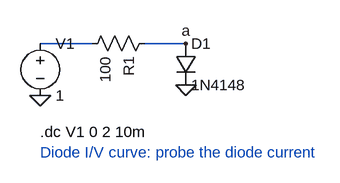
[diagram p0: schematic diode_sweep.asc]
diode_sweep.asc, the LTspice schematic file:
Version 4
SHEET 1 880 680
WIRE 64 112 144 112
WIRE 224 112 288 112
FLAG 64 192 0
FLAG 288 176 0
FLAG 288 112 a
SYMBOL voltage 64 96 R0
SYMATTR InstName V1
SYMATTR Value 1
SYMBOL res 240 96 R90
SYMATTR InstName R1
SYMATTR Value 100
SYMBOL diode 272 112 R0
SYMATTR InstName D1
SYMATTR Value 1N4148
TEXT 64 248 Left 2 !.dc V1 0 2 10m
TEXT 64 280 Left 2 ;Diode I/V curve: probe the diode current

The netlist it stands for:
* diode_sweep.asc
V1 N001 0 1
R1 a N001 100
D1 a 0 1N4148
.model D D
.lib standard.dio
.dc V1 0 2 10m
* Diode I/V curve: probe the diode current
.backanno
.end